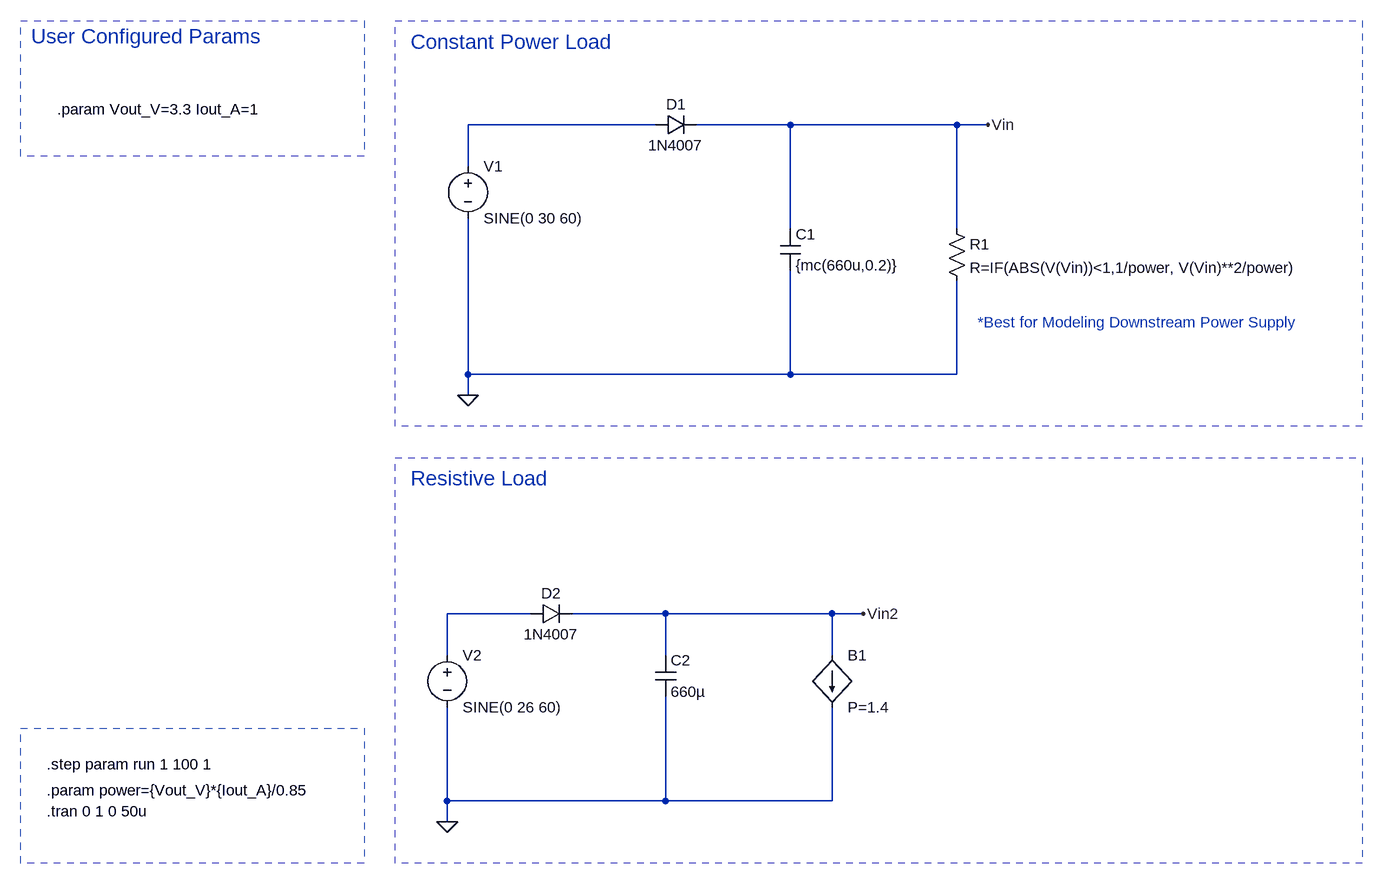
[diagram p0: schematic Cin_AuxPower.asc]
Cin_AuxPower.asc, the LTspice schematic file:
Version 4.1
SHEET 1 1400 932
WIRE 160 -208 -128 -208
WIRE 368 -208 224 -208
WIRE 624 -208 368 -208
WIRE 672 -208 624 -208
WIRE -128 -144 -128 -208
WIRE 368 -48 368 -208
WIRE 624 -48 624 -208
WIRE -128 176 -128 -64
WIRE 368 176 368 16
WIRE 368 176 -128 176
WIRE 624 176 624 32
WIRE 624 176 368 176
WIRE -128 208 -128 176
WIRE -32 544 -160 544
WIRE 176 544 32 544
WIRE 432 544 176 544
WIRE 480 544 432 544
WIRE -160 608 -160 544
WIRE 176 608 176 544
WIRE 432 608 432 544
WIRE -160 832 -160 688
WIRE 176 832 176 672
WIRE 176 832 -160 832
WIRE 432 832 432 688
WIRE 432 832 176 832
WIRE -160 864 -160 832
FLAG -128 208 0
FLAG 672 -208 Vin
FLAG -160 864 0
FLAG 480 544 Vin2
SYMBOL voltage -128 -160 R0
WINDOW 123 0 0 Left 0
WINDOW 39 0 0 Left 0
SYMATTR InstName V1
SYMATTR Value SINE(0 30 60)
SYMBOL diode 160 -192 R270
WINDOW 0 32 32 VTop 2
WINDOW 3 0 32 VBottom 2
SYMATTR InstName D1
SYMATTR Value 1N4007
SYMBOL cap 352 -48 R0
SYMATTR InstName C1
SYMATTR Value {mc(660u,0.2)}
SYMATTR SpiceLine Rser=23m
SYMBOL res 608 -64 R0
SYMATTR InstName R1
SYMATTR Value R=IF(ABS(V(Vin))<1,1/power, V(Vin)**2/power)
SYMBOL voltage -160 592 R0
WINDOW 123 0 0 Left 0
WINDOW 39 0 0 Left 0
SYMATTR InstName V2
SYMATTR Value SINE(0 26 60)
SYMBOL diode -32 560 R270
WINDOW 0 32 32 VTop 2
WINDOW 3 0 32 VBottom 2
SYMATTR InstName D2
SYMATTR Value 1N4007
SYMBOL cap 160 608 R0
SYMATTR InstName C2
SYMATTR Value 660µ
SYMATTR SpiceLine Rser=80m/3
SYMBOL bi 432 608 R0
SYMATTR InstName B1
SYMATTR Value P=1.4
TEXT -776 848 Left 2 !.tran 0 1 0 50u
TEXT -776 816 Left 2 !.param power={Vout_V}*{Iout_A}/0.85
TEXT -760 -232 Left 2 !.param Vout_V=3.3 Iout_A=1
TEXT -216 -336 Left 3 ;Constant Power Load
TEXT -216 336 Left 3 ;Resistive Load
TEXT 656 96 Left 2 ;*Best for Modeling Downstream Power Supply
TEXT -800 -344 Left 3 ;User Configured Params
TEXT -776 776 Left 2 !.step param run 1 100 1
RECTANGLE Normal 1248 256 -240 -368 1
RECTANGLE Normal 1248 928 -240 304 1
RECTANGLE Normal -288 -160 -816 -368 1
RECTANGLE Normal -288 928 -816 720 1

The netlist it stands for:
* Cin_AuxPower.asc
V1 N001 0 SINE(0 30 60)
D1 N001 Vin 1N4007
C1 Vin 0 {mc(660u,0.2)} Rser=23m
R1 Vin 0 R=IF(ABS(V(Vin))<1,1/power, V(Vin)**2/power)
V2 N002 0 SINE(0 26 60)
D2 N002 Vin2 1N4007
C2 Vin2 0 660µ Rser=80m/3
B1 Vin2 0 P=1.4
.model D D
.lib standard.dio
.tran 0 1 0 50u
.param power={Vout_V}*{Iout_A}/0.85
.param Vout_V=3.3 Iout_A=1
* Constant Power Load
* Resistive Load
* *Best for Modeling Downstream Power Supply
* User Configured Params
.step param run 1 100 1
.backanno
.end